# Altium schematic sheet SWD.SchDoc: Serial Wire Debug
size A4; ApprovedBy: LD Stanton; Author: LD Stanton; CompanyName: University of Cape Town; DrawnBy: Lawrence Stanton; Engineer: Lawrence Stanton; Organization: University of Cape Town; Address1: Department of Electrical Engineering; Address2: Rondebosch; Address3: Cape Town; Address4: South Africa 7701; DocumentNumber: 6; SheetNumber: 6; SheetTotal: 14
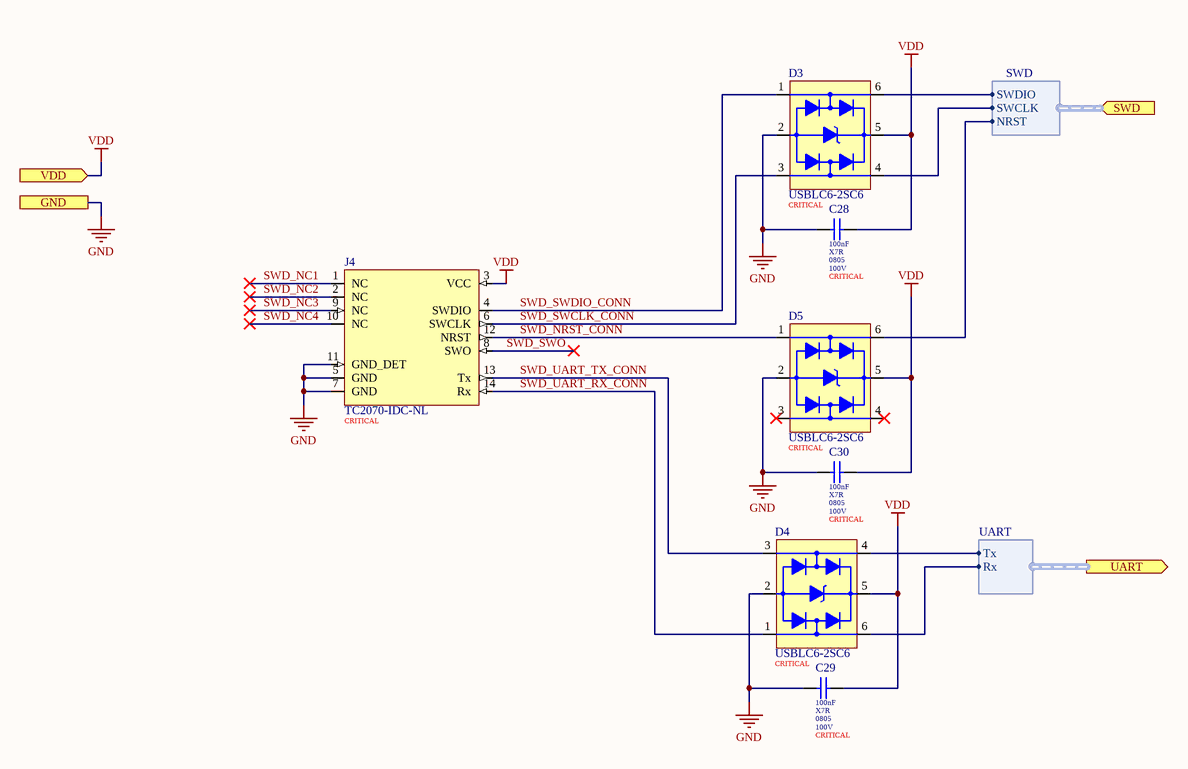
[diagram p0: SWD.SchDoc]

## Parts
C28  value 100nF  Dielectric: X7R  Package: 0805  Voltage: 100V  Populate: CRITICAL  [0805_125_F (Samsumg) B]  (hidden comment: CL21B104KCFNNNE)
C29  value 100nF  Dielectric: X7R  Package: 0805  Voltage: 100V  Populate: CRITICAL  [0805_125_F (Samsumg) B]  (hidden comment: CL21B104KCFNNNE)
C30  value 100nF  Dielectric: X7R  Package: 0805  Voltage: 100V  Populate: CRITICAL  [0805_125_F (Samsumg) B]  (hidden comment: CL21B104KCFNNNE)
D3  USBLC6-2SC6  Placement: CRITICAL  [SOT-23-6 (USBLC6-2SC6 ST) B]
D4  USBLC6-2SC6  Placement: CRITICAL  [SOT-23-6 (USBLC6-2SC6 ST) B]
D5  USBLC6-2SC6  Placement: CRITICAL  [SOT-23-6 (USBLC6-2SC6 ST) B]
J4  TC2070-IDC-NL  Placement: CRITICAL  [TC2070 NL]  (no BOM)

## Ports
GND, SWD (in, harness SWD), UART (out, harness UART), VDD (in)

## Harnesses
SWD: SWDIO, SWCLK, NRST
UART: Tx, Rx

## Nets
GND: C28.1 C29.1 C30.1 D3.2(GND) D4.2(GND) D5.2(GND) J4.5(GND) J4.7(GND) J4.11(GND_DET) ; port GND
VDD: C28.2 C29.2 C30.2 D3.5(VBUS) D4.5(VBUS) D5.5(VBUS) J4.3(VCC) ; port VDD
SWD_NC1: J4.1(NC)
SWD_NC2: J4.2(NC)
SWD_NC3: J4.9(NC)
SWD_NC4: J4.10(NC)
SWD_NRST_CONN: D5.1(I/O_1) J4.12(NRST)
SWD_SWCLK_CONN: D3.3(I/O_2) J4.6(SWCLK)
SWD_SWDIO_CONN: D3.1(I/O_1) J4.4(SWDIO)
SWD_SWO: J4.8(SWO)
SWD_UART_RX_CONN: D4.1(I/O_1) J4.14(Rx)
SWD_UART_TX_CONN: D4.3(I/O_2) J4.13(Tx)
NetD3_4: D3.4(I/O_3) ; port SWD.SWCLK
NetD3_6: D3.6(I/O_4) ; port SWD.SWDIO
NetD4_4: D4.4(I/O_3) ; port UART.Tx
NetD4_6: D4.6(I/O_4) ; port UART.Rx
NetD5_6: D5.6(I/O_4) ; port SWD.NRST

Not connected (* = marked no-connect by the designer): D5 3(I/O_2)* 4(I/O_3)*

## Notes on the sheet
- Size:
- Date:
- A4
- Number:
- Time:
- Revision:
- Sheet
- of
- File:
- Author:

## Library data of the parts
C28-C30 = CMP-00100-3: MLCC 100nF 0805 100V X7R ±10%; Manufacturer: Samsung; ComponentLink1URL: https://datasheet.lcsc.com/szlcsc/Samsung-Electro-Mechanics-CL05C100JB5NNNC_C32949.pdf; LCSC Part Number: C28233; ComponentLink1Description: Datasheet; Tolerance: ±10%
D3-D5 = CMP-000039-5: TVS Diode Array Low Capacitance SOT23-6; Manufacturer: ST Microelectronics; Peak Pulse Current: 5A; Data Rate: 480Mbps; Breakdown Voltage: 6V; Leakage Current: 150nA; Clamping Voltage: 17V; Capacitance: 3.5pF; RoHS Compliant: Yes; Min Operating Temperature: -40°C; ComponentLink1URL: https://www.st.com/resource/en/datasheet/usblc6-2.pdf; Case/Package: SOT-23-6; LCSC Part Number: C7519; ComponentLink1Description: Datasheet; Max Operating Temperature: 125°C
J4 = CMP-00121-2: 14-Pin Plug-of-nails connector for SWD Footprint; ComponentLink2URL: https://www.tag-connect.com/product/tc2070-idc-nl-050; ComponentLink2Description: Product Page; ComponentLink1URL: https://www.tag-connect.com/wp-content/uploads/bsk-pdf-manager/TC2070-IDC-NL_Datasheet_12.pdf; ComponentLink1Description: Datasheet